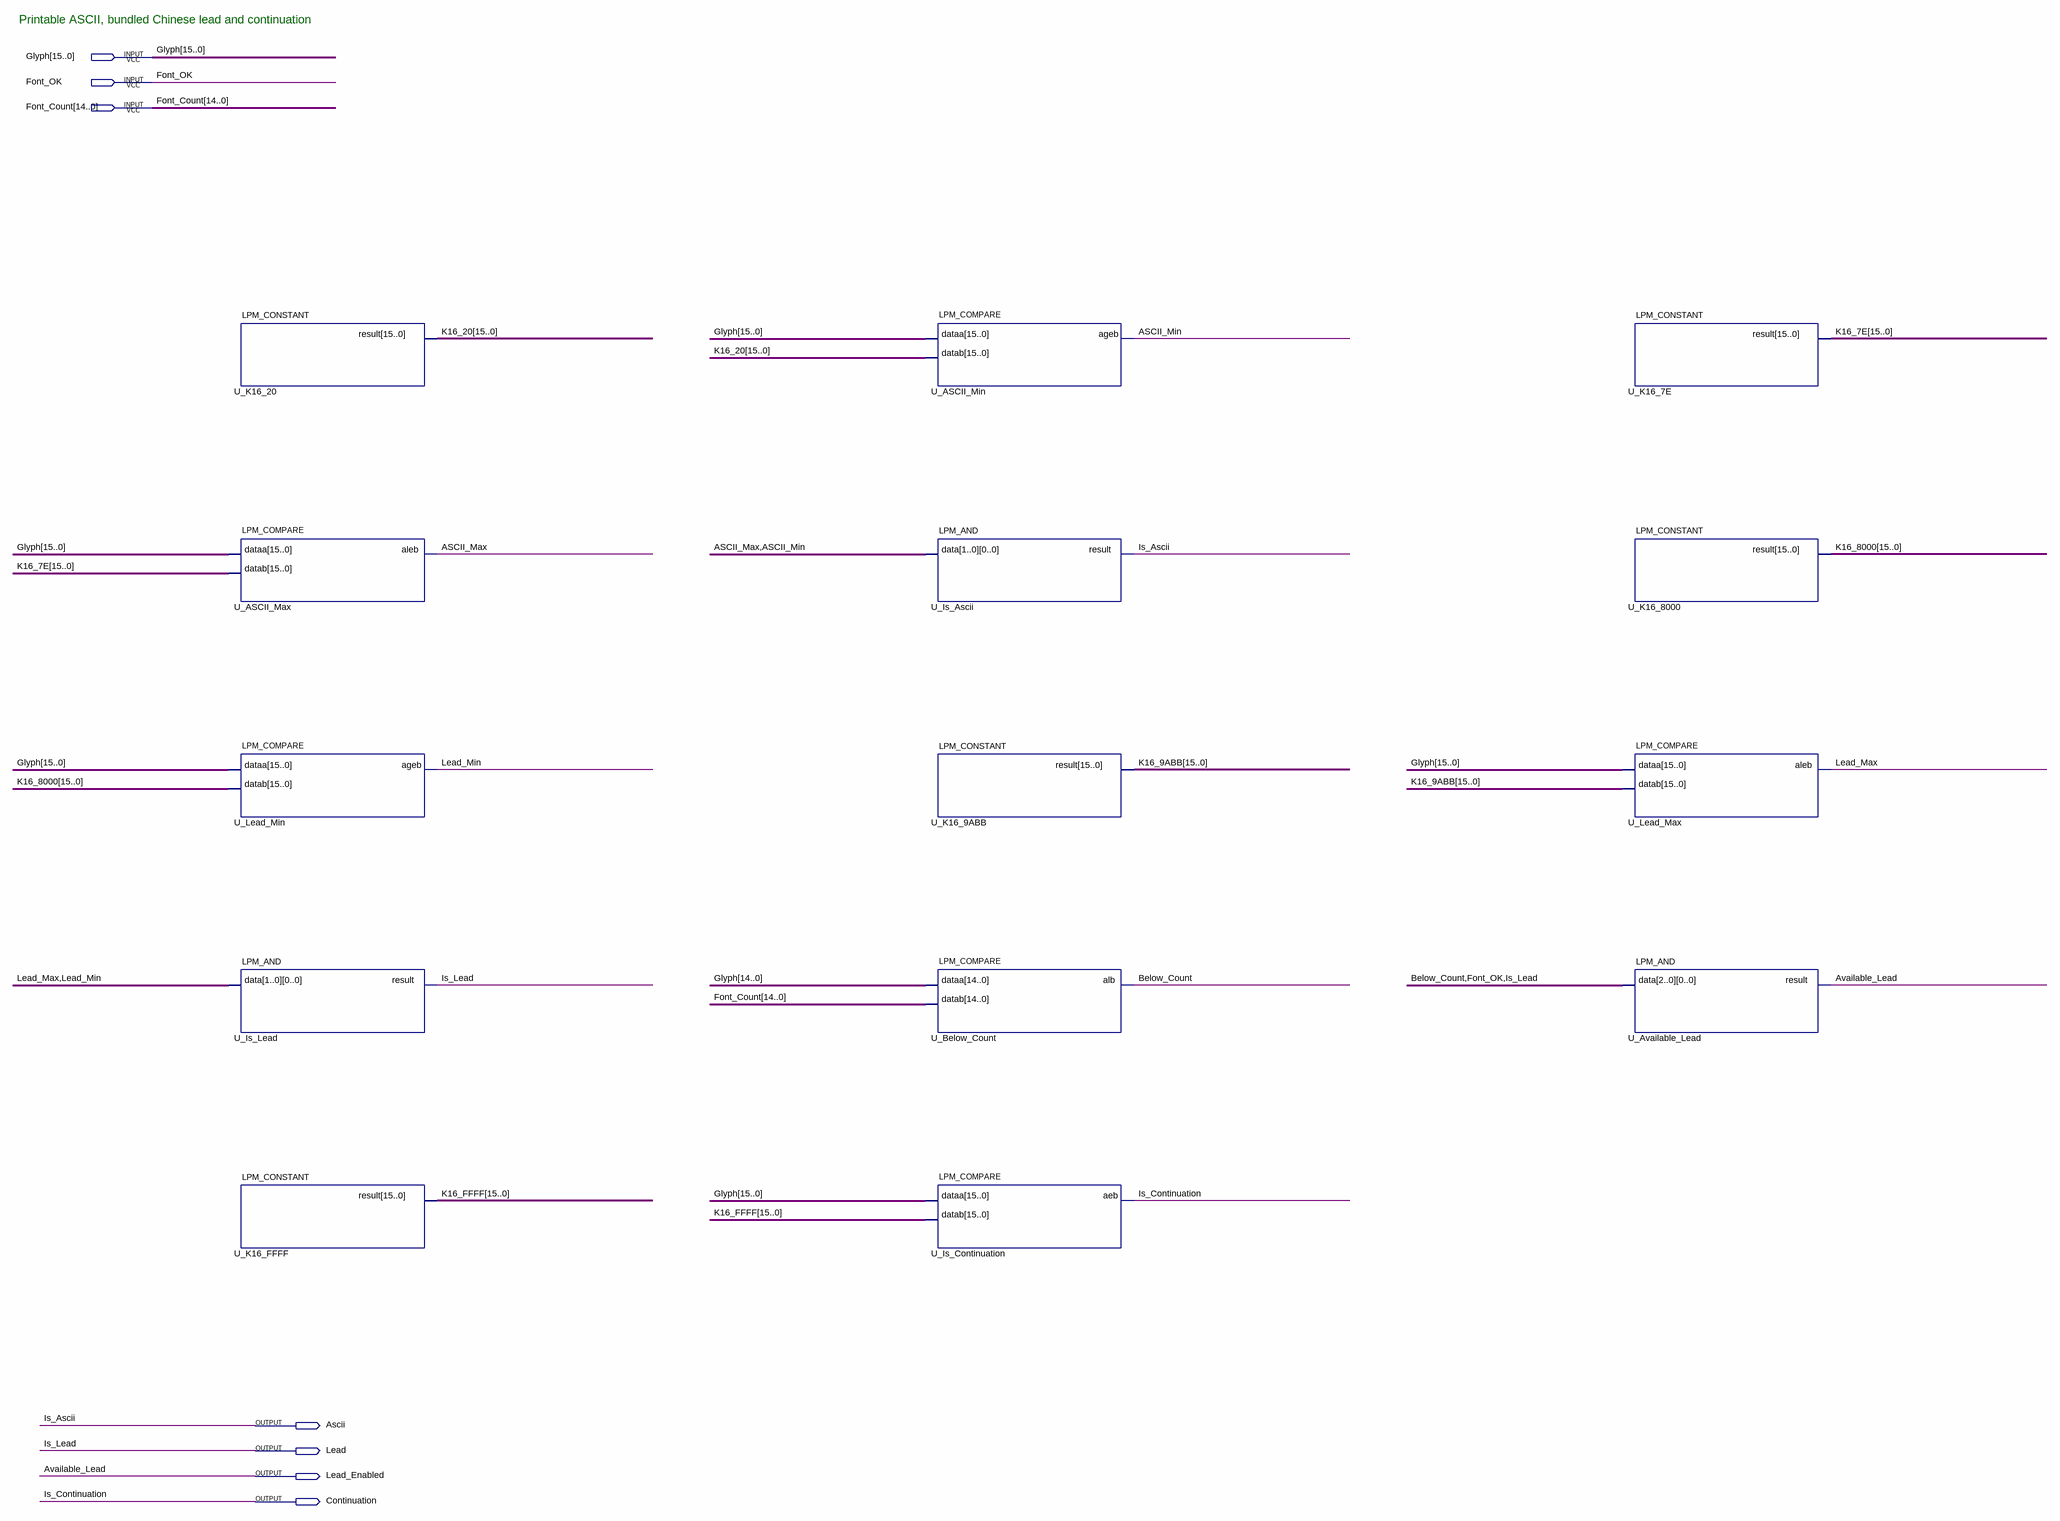
[diagram p0: schematic sheet]
// Quartus schematic Glyph_Class.bdf as structural Verilog: 14 symbols, 7 pins
module Glyph_Class (
  input  [15:0] Glyph,
  input  Font_OK,
  input  [14:0] Font_Count,
  output Ascii,
  output Lead,
  output Lead_Enabled,
  output Continuation
);

  wire ASCII_Max, ASCII_Min, Below_Count, Lead_Max, Lead_Min;
  wire [15:0] K16_7E, K16_9ABB, K16_20, K16_8000, K16_FFFF;

  LPM_CONSTANT #(.LPM_WIDTH(16), .LPM_CVALUE(32)) U_K16_20 (.result(K16_20));
  LPM_COMPARE #(.LPM_WIDTH(16), .LPM_REPRESENTATION("UNSIGNED")) U_ASCII_Max (
    .dataa(Glyph), .datab(K16_7E), .aleb(ASCII_Max));
  LPM_COMPARE #(.LPM_WIDTH(16), .LPM_REPRESENTATION("UNSIGNED")) U_Lead_Min (
    .dataa(Glyph), .datab(K16_8000), .ageb(Lead_Min));
  LPM_AND #(.LPM_WIDTH(1), .LPM_SIZE(2)) U_Is_Lead (.data({Lead_Max, Lead_Min}), .result(Lead));
  LPM_CONSTANT #(.LPM_WIDTH(16), .LPM_CVALUE(65535)) U_K16_FFFF (.result(K16_FFFF));
  LPM_COMPARE #(.LPM_WIDTH(16), .LPM_REPRESENTATION("UNSIGNED")) U_ASCII_Min (
    .dataa(Glyph), .datab(K16_20), .ageb(ASCII_Min));
  LPM_AND #(.LPM_WIDTH(1), .LPM_SIZE(2)) U_Is_Ascii (.data({ASCII_Max, ASCII_Min}), .result(Ascii));
  LPM_CONSTANT #(.LPM_WIDTH(16), .LPM_CVALUE(39611)) U_K16_9ABB (.result(K16_9ABB));
  LPM_COMPARE #(.LPM_WIDTH(15), .LPM_REPRESENTATION("UNSIGNED")) U_Below_Count (
    .dataa(Glyph[14:0]), .datab(Font_Count), .alb(Below_Count));
  LPM_COMPARE #(.LPM_WIDTH(16), .LPM_REPRESENTATION("UNSIGNED")) U_Is_Continuation (
    .dataa(Glyph), .datab(K16_FFFF), .aeb(Continuation));
  LPM_CONSTANT #(.LPM_WIDTH(16), .LPM_CVALUE(126)) U_K16_7E (.result(K16_7E));
  LPM_CONSTANT #(.LPM_WIDTH(16), .LPM_CVALUE(32768)) U_K16_8000 (.result(K16_8000));
  LPM_COMPARE #(.LPM_WIDTH(16), .LPM_REPRESENTATION("UNSIGNED")) U_Lead_Max (
    .dataa(Glyph), .datab(K16_9ABB), .aleb(Lead_Max));
  LPM_AND #(.LPM_WIDTH(1), .LPM_SIZE(3)) U_Available_Lead (.data({Below_Count, Font_OK, Lead}), .result(Lead_Enabled));

  // Other names for the same wires on the sheet: Available_Lead = Lead_Enabled; Is_Ascii = Ascii;
  //   Is_Continuation = Continuation; Is_Lead = Lead

  // Notes on the sheet:
  //   Printable ASCII, bundled Chinese lead and continuation
endmodule
